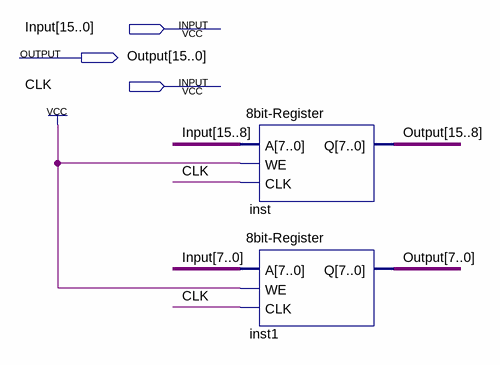
[diagram p0: schematic sheet]
// Quartus schematic 16bit-Register.bdf as structural Verilog: 2 symbols, 3 pins
module \16bit-Register  (
  input  [15:0] Input,
  input  CLK,
  output [15:0] Output
);

  \8bit-Register  inst (.A(Input[15:8]), .WE(1'b1), .CLK(CLK), .Q(Output[15:8]));
  \8bit-Register  inst1 (.A(Input[7:0]), .WE(1'b1), .CLK(CLK), .Q(Output[7:0]));
endmodule
